# EAGLE design opl3_module_2x_gain (EAGLE 4.16)
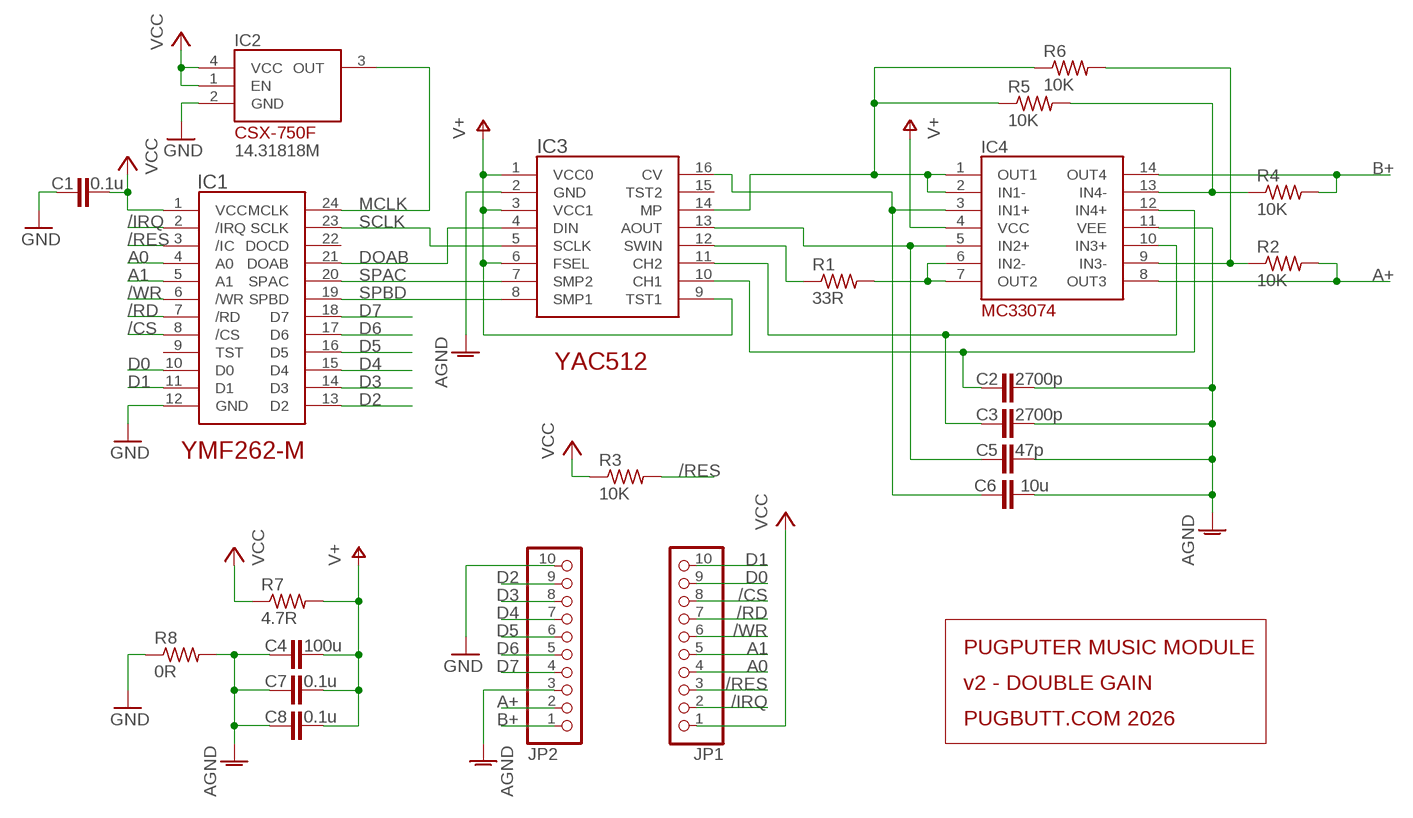
[diagram p0: schematic, sheet 1]

## Parts
C1  0.1u  C-EUC0603  [C0603]
C2  2700p  C-EUC0603  [C0603]
C3  2700p  C-EUC0603  [C0603]
C4  100u  C-EUC0805  [C0805]
C5  47p  C-EUC0603  [C0603]
C6  10u  C-EUC0805  [C0805]
C7  0.1u  C-EUC0603  [C0603]
C8  0.1u  C-EUC0603  [C0603]
IC1  YMF262-M  YMF262  [YMF262_SOP24]
IC2  14.31818M  OSC_CSX-750F  [XTAL_CSX-750F]
IC3  YAC512  [YAC512]
IC4  MC33074  [SOIC14]
JP1  PINHD-1X10  [1X10]
JP2  PINHD-1X10  [1X10]
R1  33R  R-US_R0603  [R0603]
R2  10K  R-US_R0603  [R0603]
R3  10K  R-US_R0603  [R0603]
R4  10K  R-US_R0603  [R0603]
R5  10K  R-US_R0603  [R0603]
R6  10K  R-US_R0603  [R0603]
R7  4.7R  R-US_R0603  [R0603]
R8  0R  R-US_R0603  [R0603]

## Nets
/CS: IC1.8(/CS) JP1.8
/IRQ: IC1.2(/IRQ) JP1.2
/RD: IC1.7(/RD) JP1.7
/RES: IC1.3(/IC) JP1.3 R3.2
/WR: IC1.6(/WR) JP1.6
A0: IC1.4(A0) JP1.4
A1: IC1.5(A1) JP1.5
A+: IC4.8(OUT3) JP2.2 R2.2
AGND [agnd]: C2.2 C3.2 C4.1 C5.2 C6.2 C7.1 C8.1 IC3.2(GND) IC4.11(VEE) JP2.3 R8.2
B+: IC4.14(OUT4) JP2.1 R4.2
D0: IC1.10(D0) JP1.9
D1: IC1.11(D1) JP1.10
D2: IC1.13(D2) JP2.9
D3: IC1.14(D3) JP2.8
D4: IC1.15(D4) JP2.7
D5: IC1.16(D5) JP2.6
D6: IC1.17(D6) JP2.5
D7: IC1.18(D7) JP2.4
DOAB: IC1.21(DOAB) IC3.4(DIN)
GND [agnd]: C1.1 IC1.12(GND) IC2.2(GND) JP2.10 R8.1
MCLK: IC1.24(MCLK) IC2.3(OUT)
N$1: IC4.9(IN3-) R2.1 R6.2
N$2: IC4.13(IN4-) R4.1 R5.2
N$3: C6.1 IC3.16(CV) IC4.3(IN1+)
N$7: IC3.12(SWIN) R1.1
N$8: C3.1 IC3.11(CH2) IC4.10(IN3+)
N$9: C2.1 IC3.10(CH1) IC4.12(IN4+)
N$10: C5.1 IC3.13(AOUT) IC4.5(IN2+)
O1: IC3.14(MP) IC4.1(OUT1) IC4.2(IN1-) R5.1 R6.1
O2: IC4.6(IN2-) IC4.7(OUT2) R1.2
SCLK: IC1.23(SCLK) IC3.5(SCLK)
SPAC: IC1.20(SPAC) IC3.7(SMP2)
SPBD: IC1.19(SPBD) IC3.8(SMP1)
V+: C4.2 C7.2 C8.2 IC3.1(VCC0) IC3.3(VCC1) IC3.6(FSEL) IC3.9(TST1) IC4.4(VCC) R7.2
VCC [supply]: C1.2 IC1.1(VCC) IC2.1(EN) IC2.4(VCC) JP1.1 R3.1 R7.1
Unconnected: IC1.9(TST) IC1.22(DOCD) IC3.15(TST2)

## Notes on the sheet
- YAC512
- YMF262-M
- PUGPUTER MUSIC MODULE
- v2 - DOUBLE GAIN
- PUGBUTT.COM 2026

## Library data of the parts
C1-C8 = rcl:C-EU: CAPACITOR, European symbol
IC1 = 07-Retrocomputing:YMF262
IC2 = 07-Retrocomputing:OSC_CSX-750F
IC3 = 07-Retrocomputing:YAC512
IC4 = 07-Retrocomputing:MC33074
JP1 JP2 = pinhead:PINHD-1X10: PIN HEADER
R1-R8 = rcl:R-US_: RESISTOR, American symbol

## Net classes
0 default: width 0.203 mm, drill 0.203 mm, clearance 0.254 mm
1 supply: width 0.61 mm, drill 0.203 mm, clearance 0.305 mm
2 agnd: width 0.406 mm, drill 0.203 mm, clearance 0.305 mm

## Board
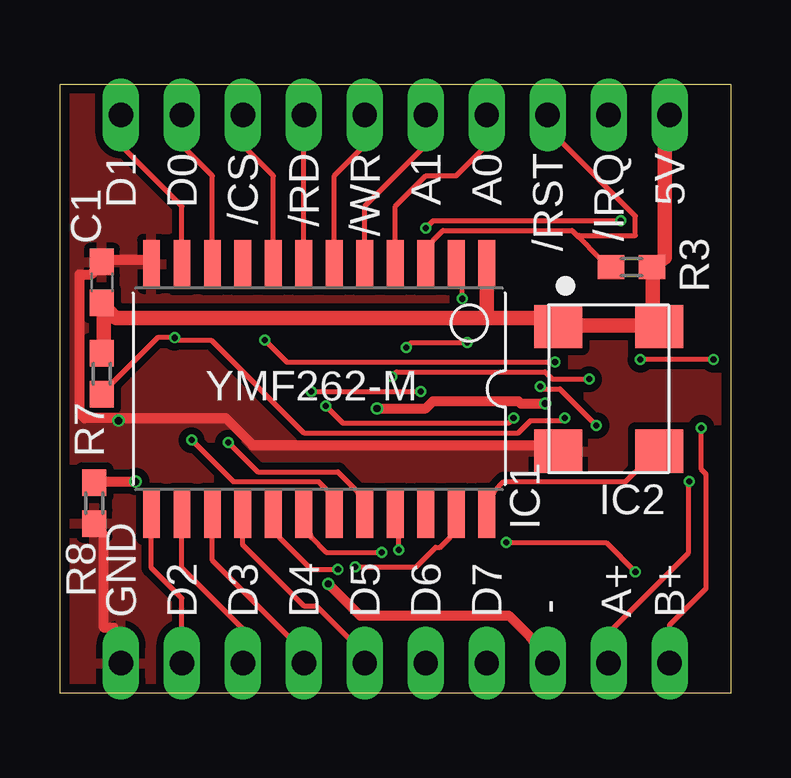
[diagram p1: board, top side]
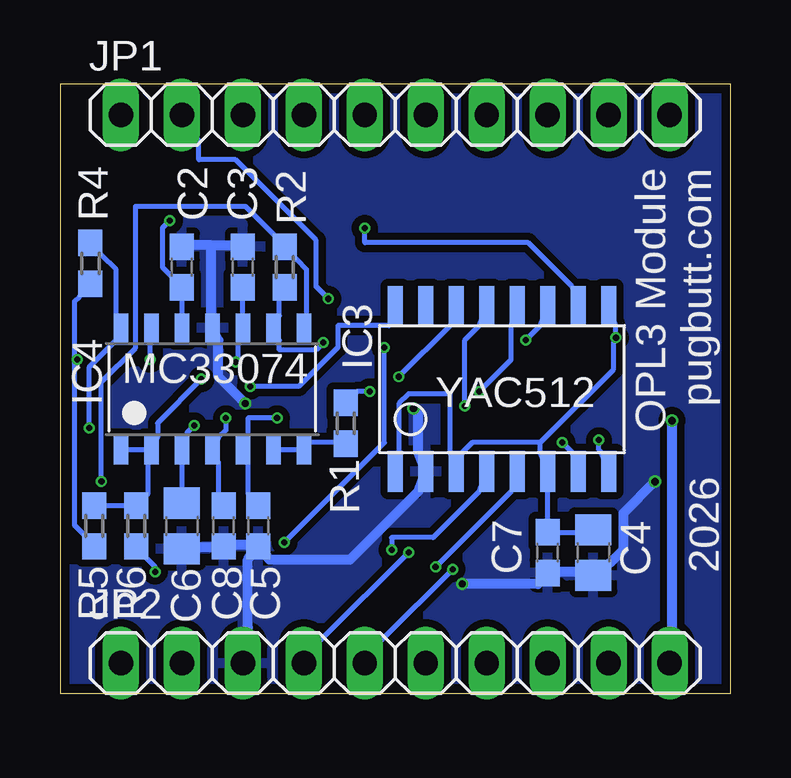
[diagram p2: board, bottom side, seen from below]

Size 27.94 x 25.4 mm. Coordinates in mm from the lower left corner, seen from the top.
Outline: 0,0 0,25.4 27.94,25.4 27.94,0 0,0
Copper layers (1*2*15*16): Top 0.0356mm / dielectric 0.1702mm / Route2 0.0178mm / dielectric 1.1938mm / Route15 0.0178mm / dielectric 0.1702mm / Bottom 0.0356mm
Design rules "oshpark-4layer": minimum track width 5mil, minimum drill 10mil, track to track 5mil, track to pad 5mil, pad to pad 5mil, via to via 5mil, smd to smd 5mil, copper to edge 15mil, drill to drill 6mil, minimum pad ring 4mil, minimum via ring 4mil, stop-mask expansion 2.5mil, vias tented up to drill 0mil, thermal gap 10mil

### Footprints (pad centres in the part's own frame; a part is rotated, then mirrored left to right if it is on the bottom)
C0603 = smd 1.1 x 1: 1 -0.85,0; 2 0.85,0
C0805 = smd 1.3 x 1.5: 1 -0.95,0; 2 0.95,0
YMF262_SOP24 = smd 2 x 0.7: 1 -5.215,6.985; 2 -5.215,5.715; 3 -5.215,4.445; 4 -5.215,3.175; 5 -5.215,1.905; 6 -5.215,0.635; 7 -5.215,-0.635; 8 -5.215,-1.905; 9 -5.215,-3.175; 10 -5.215,-4.445; 11 -5.215,-5.715; 12 -5.215,-6.985; 13 5.215,-6.985; 14 5.215,-5.715; 15 5.215,-4.445; 16 5.215,-3.175; 17 5.215,-1.905; 18 5.215,-0.635; 19 5.215,0.635; 20 5.215,1.905; 21 5.215,3.175; 22 5.215,4.445; 23 5.215,5.715; 24 5.215,6.985
XTAL_CSX-750F = smd 1.8 x 2: 1 -2.6,-2.1; 2 2.6,-2.1; 3 2.6,2.1; 4 -2.6,2.1
YAC512 = smd 1.7 x 0.635: 1 -3.435,4.445; 2 -3.435,3.175; 3 -3.435,1.905; 4 -3.435,0.635; 5 -3.435,-0.635; 6 -3.435,-1.905; 7 -3.435,-3.175; 8 -3.435,-4.445; 9 3.435,-4.445; 10 3.435,-3.175; 11 3.435,-1.905; 12 3.435,-0.635; 13 3.435,0.635; 14 3.435,1.905; 15 3.435,3.175; 16 3.435,4.445
SOIC14 = smd 1.2 x 0.6: 1 -2.54,3.81; 2 -2.54,2.54; 3 -2.54,1.27; 4 -2.54,0; 5 -2.54,-1.27; 6 -2.54,-2.54; 7 -2.54,-3.81; 8 2.54,-3.81; 9 2.54,-2.54; 10 2.54,-1.27; 11 2.54,0; 12 2.54,1.27; 13 2.54,2.54; 14 2.54,3.81
1X10 = drill 1.016 long: 1 -11.43,0; 2 -8.89,0; 3 -6.35,0; 4 -3.81,0; 5 -1.27,0; 6 1.27,0; 7 3.81,0; 8 6.35,0; 9 8.89,0; 10 11.43,0
R0603 = smd 1.1 x 1: 1 -0.85,0; 2 0.85,0

### Placement (x,y rotation side)
C1  1.75,17.14 270 top
C2  22.86,17.78 90 bottom
C3  20.32,17.78 90 bottom
C4  5.71,5.87 90 bottom
C5  19.68,6.99 270 bottom
C6  22.86,6.99 270 bottom
C7  7.62,5.87 90 bottom
C8  21.11,6.99 90 bottom
IC1  10.79,12.7 270 top
IC2  22.86,12.7 270 top
IC3  9.53,12.7 90 bottom
IC4  21.59,12.7 90 bottom
JP1  13.97,24.13 0 bottom
JP2  13.97,1.27 0 bottom
R1  16.03,11.27 270 bottom
R2  18.57,17.78 90 bottom
R3  23.81,17.78 180 top
R4  26.67,17.94 90 bottom
R5  26.51,6.99 270 bottom
R6  24.76,6.99 270 bottom
R7  1.75,13.34 270 top
R8  1.43,7.94 90 top

### Tracks (layer width: path | path; a pad name or v marks a point on that pad's centre or on a via)
/CS
  Top 0.203: IC1.8 8.89,21.59 7.62,22.86 JP1.8
/IRQ  (via drill 0.25)
  Top 0.203: v16.76,16.46 16.76,16.97 IC1.2
  Bottom 0.203: v16.76,16.46 17.27,16.97 17.27,18.9 20.62,22.25 22.15,22.25 22.15,23.06 JP1.2
/RD
  Top 0.203: IC1.7 JP1.7
/RES
  Top 0.203: 21.59,19.05 21.34,19.3 15.95,19.3 15.54,18.9 IC1.3 | 21.59,19.05 22.45,18.19 R3.2 | JP1.3 20.93,22.96 23.98,19.91 23.98,19.1 21.64,19.1 21.59,19.05
/WR
  Top 0.203: IC1.6 11.43,21.59 12.7,22.86 JP1.6
A0
  Top 0.203: IC1.4 13.97,20.32 15.24,21.59 16.51,21.59 17.78,22.86 JP1.4
A1
  Top 0.203: IC1.5 12.7,20.32 15.24,22.86 JP1.5
A+  (via drill 0.25)
  Top 0.203: JP2.2 22.86,2.54 26.19,5.87 26.19,8.86 | 26.19,8.86 26.19,8.89 | 26.19,8.86 v26.21,8.84
  Bottom 0.203: IC4.8 17.68,15.75 17.68,17.68 18.09,18.09 R2.2 19,19.1 20.22,20.32 24.79,20.32 24.79,14.41 26.21,12.99 v26.21,8.84
AGND  (via drill 0.3)
  Top 0.406: v3.15,8.84 1.83,8.84 R8.2 | v20.22,12.09 19.2,12.09 19.1,12.19 15.54,12.19 15.24,11.89 v13.21,11.89 | v11.18,4.57 12.5,3.25 18.69,3.25 19.61,2.34 JP2.3
  Bottom 0.406: v3.15,8.84 4.47,7.52 4.47,5.99 4.98,5.49 C4.1 6.4,5.08 7.21,5.08 C7.1 8.03,4.57 v11.18,4.57 | 21.64,18.69 22.45,18.69 C2.2 | 21.64,18.69 20.73,18.69 C3.2 | 21.64,18.69 21.64,15.75 IC4.11 21.34,14.73 21.34,13.21 v20.22,12.09 | C5.2 20.12,6.2 20.62,6.2 C8.1 21.54,6.1 22.15,6.1 C6.2 | C5.2 19.2,5.59 15.85,5.59 13.01,8.43 IC3.2 13.01,10.06 13.01,11.68 v13.21,11.89 | JP2.3 20.12,2.74 20.12,5.59 C5.2
  pour Bottom: 0,25.4 27.94,25.4 27.94,0 0,0
B+  (via drill 0.25)
  Top 0.203: v26.72,11.07 26.72,9.35 26.92,9.14 26.92,4.38 25.4,2.86 JP2.1
  Bottom 0.203: R4.2 26.21,18.29 25.6,17.68 25.6,15.75 IC4.14 25.6,14.73 26.72,13.61 v26.72,11.07
D0
  Top 0.203: IC1.10 6.35,21.59 5.08,22.86 JP1.9
D1
  Top 0.203: IC1.11 5.08,20.32 2.54,22.86 JP1.10
D2
  Top 0.203: JP2.9 5.08,3.97 3.81,5.24 IC1.13 3.81,7.62
D3
  Top 0.203: JP2.8 7.62,2.7 5.08,5.24 IC1.14
D4
  Top 0.203: JP2.7 10.16,1.75 6.35,5.56 IC1.15
D5
  Top 0.203: JP2.6 11.99,2.34 10.67,3.66 10.15,3.66 7.62,6.19 IC1.16
D6  (via drill 0.25)
  Top 0.203: v11.58,5.18 10.46,5.18 9.14,6.5 IC1.17
  Bottom 0.203: v11.58,5.18 14.53,2.23 JP2.5
D7  (via drill 0.25)
  Top 0.203: v13.41,5.89 11.07,5.89 10.46,6.5 IC1.18
  Bottom 0.203: v13.41,5.89 17.07,2.23 JP2.4
DOAB  (via drill 0.25)
  Top 0.203: v14.12,5.99 14.12,6.5 IC1.21
  Bottom 0.203: v14.12,5.99 14.12,6.5 12.39,6.5 10.46,8.43 IC3.4
GND  (via drill 0.3)
  Top 0.406: R8.1 1.83,6.6 1.83,2.74 2.23,2.74 JP2.10 | IC1.12 3.56,18.09 2.23,18.09 C1.1 1.32,17.48 0.81,17.48 0.81,11.68 1.02,11.48 2.44,11.48 | 2.44,11.48 6.91,11.48 8.03,10.36 19.81,10.36 IC2.2 | v2.44,11.38 2.44,11.48
  Bottom 0.406: v2.44,11.38 2.44,2.74 JP2.10
  pour Top: 0,25.4 27.94,25.4 27.94,0 0,0
MCLK
  Top 0.203: IC1.24 18.09,8.43 18.49,8.84 23.57,8.84 23.98,9.25 IC2.3
N$1  (via drill 0.25)
  Top 0.203: v23.98,5.08 22.76,6.3 v18.59,6.3 | v14.43,14.43 14.63,14.63 v16.97,14.63
  Bottom 0.203: R2.1 18.8,16.46 18.8,15.75 IC4.9 18.8,14.73 18.8,14.33 17.27,14.33 v16.97,14.63 | v23.98,5.08 23.98,5.28 24.28,5.59 R6.2 | v18.59,6.3 14.43,10.46 v14.43,14.43
N$2  (via drill 0.25)
  Top 0.203: v27.23,13.92 v24.18,13.92
  Bottom 0.203: 27.33,13.92 27.33,16.36 27.13,16.56 R4.1 | 27.33,13.92 27.33,7.01 26.92,6.6 R5.2 | v24.18,13.92 24.18,14.73 IC4.13 | 27.33,13.92 v27.23,13.92
N$3  (via drill 0.25)
  Top 0.203: v20.02,12.8 20.12,12.7 20.83,12.7 v22.35,11.18
  Bottom 0.203: C6.1 IC4.3 22.66,10.67 22.66,10.87 v22.35,11.18 | v20.02,12.8 17.98,12.8 16.36,14.43 16.36,15.34 14.22,15.34 IC3.16
N$7  (via drill 0.25)
  Top 0.203: v10.46,12.6 v15.04,12.6
  Bottom 0.203: v15.04,12.6 15.54,12.6 R1.1 | v10.46,12.6 9.14,13.92 9.14,15.34 IC3.12
N$8  (via drill 0.25)
  Top 0.203: v8.53,14.73 9.45,13.82 v20.62,13.82
  Bottom 0.203: C3.1 IC4.10 20.52,14.73 20.52,13.92 v20.62,13.82 | v8.53,14.73 7.92,15.34 IC3.11
N$9  (via drill 0.25)
  Top 0.203: v15.24,19.41 15.54,19.71 v23.37,19.71
  Bottom 0.203: IC4.12 C2.1 23.27,17.37 23.67,17.78 23.67,19.41 v23.37,19.71 | v15.24,19.41 15.24,18.8 8.43,18.8 6.6,16.97 IC3.10
N$10  (via drill 0.25)
  Top 0.203: v11.07,11.99 11.79,11.28 18.69,11.28 v18.9,11.48
  Bottom 0.203: C5.1 20.12,8.33 20.12,9.65 IC4.5 20.12,10.67 20.12,11.48 v18.9,11.48 | v11.07,11.99 11.07,14.73 10.46,15.34 IC3.13
O1  (via drill 0.25)
  Top 0.203: v13.82,13.21 14.02,13.41 20.22,13.41 20.52,13.11 v22.05,13.11
  Bottom 0.203: IC4.2 IC4.1 | R5.1 26.11,7.82 25.2,7.82 R6.1 24.28,8.33 24.28,9.65 IC4.2 | v13.82,13.21 11.68,15.34 IC3.14 | v22.05,13.11 23.88,11.28 23.88,10.67 IC4.2
O2
  Bottom 0.203: R1.2 16.46,10.46 17.58,10.46 IC4.7 IC4.6
SCLK  (via drill 0.25)
  Top 0.203: v12.29,5.28 14.83,5.28 15.65,6.1 15.85,6.1 16.26,6.5 IC1.23
  Bottom 0.203: v12.29,5.28 9.14,8.43 IC3.5
SPAC  (via drill 0.25)
  Top 0.203: v7.01,10.46 8.23,9.25 11.58,9.25 12.39,8.43 IC1.20
  Bottom 0.203: v7.01,10.46 6.6,10.06 IC3.7
SPBD  (via drill 0.25)
  Top 0.203: v5.49,10.57 7.21,8.84 10.77,8.84 11.18,8.43 IC1.19
  Bottom 0.203: v5.49,10.57 5.49,10.16 5.38,10.06 IC3.8
V+  (via drill 0.25)
  Top 0.203: R7.2 2.23,13.01 4.06,14.83 v4.78,14.83 4.98,14.73 6.3,14.73 10.16,10.87 19.1,10.87 19.61,11.38 20.93,11.38 v21.03,11.48
  Bottom 0.203: C4.2 6.4,6.71 7.21,6.71 C7.2 IC3.6 7.92,10.06 7.92,10.46 | 7.92,10.46 10.77,10.46 11.18,10.06 IC3.3 11.68,10.06 11.68,12.5 13.41,12.5 13.82,12.09 13.82,10.06 IC3.1 | C8.2 21.34,8.33 21.34,9.65 IC4.4 21.34,10.67 21.03,10.97 v21.03,11.48 | IC3.9 4.78,15.34 v4.78,14.83 4.88,14.63 4.88,13.51 7.92,10.46
VCC
  Top 0.61: R7.1 1.83,14.73 1.83,15.75 C1.2 2.23,15.75 2.34,15.65 17.78,15.65 | 17.78,15.65 19.81,15.65 IC2.1 21.74,15.34 23.98,15.34 IC2.4 24.69,16.15 24.69,17.37 R3.1 25.2,18.19 25.2,22.66 JP1.1 | 17.78,15.65 IC1.1

### Text on the board
tNames: D1 | D0 | /CS | /RD | /WR | A1 | A0 | /RST | /IRQ | 5V | GND | D2 | D3 | D4 | D5 | D6 | D7 | - | A+ | B+
bNames: pugbutt.com | OPL3 Module | 2026